# Altium schematic sheet Buttons_Section.SchDoc
size A4; DocumentNumber: 5; SheetNumber: 5; SheetTotal: 6
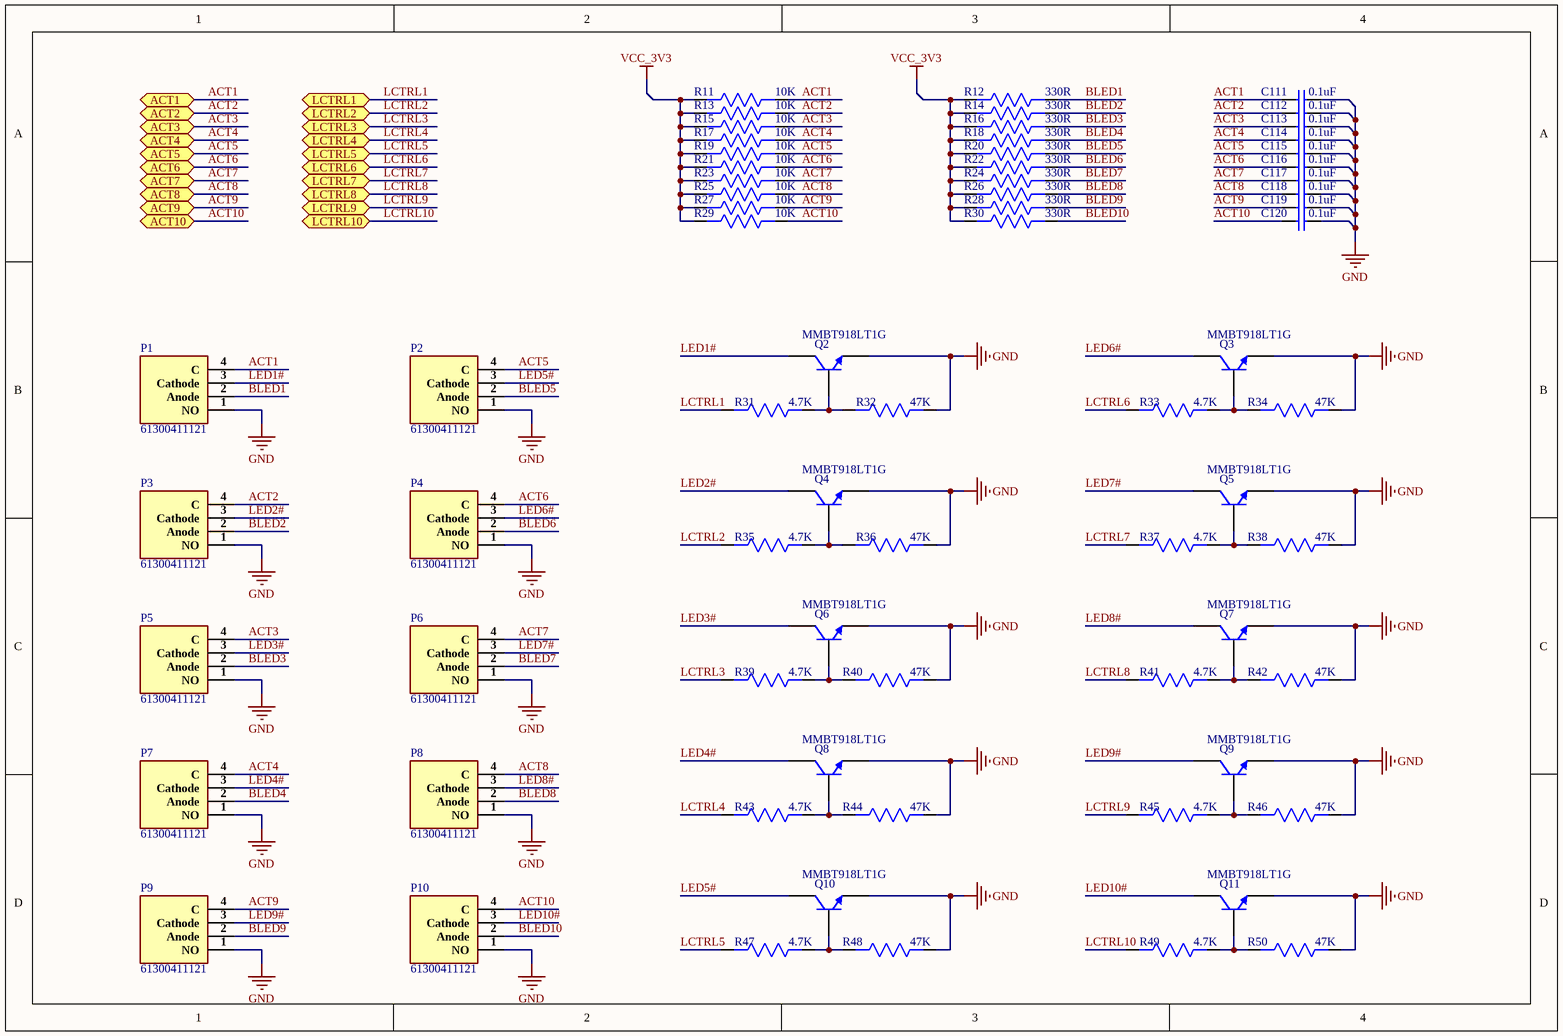
[diagram p0: Buttons_Section.SchDoc]

## Parts
C111  0.1uF  [Cap0402]
C112  0.1uF  [Cap0402]
C113  0.1uF  [Cap0402]
C114  0.1uF  [Cap0402]
C115  0.1uF  [Cap0402]
C116  0.1uF  [Cap0402]
C117  0.1uF  [Cap0402]
C118  0.1uF  [Cap0402]
C119  0.1uF  [Cap0402]
C120  0.1uF  [Cap0402]
P1  61300411121  [HDR1X4]
P2  61300411121  [HDR1X4]
P3  61300411121  [HDR1X4]
P4  61300411121  [HDR1X4]
P5  61300411121  [HDR1X4]
P6  61300411121  [HDR1X4]
P7  61300411121  [HDR1X4]
P8  61300411121  [HDR1X4]
P9  61300411121  [HDR1X4]
P10  61300411121  [HDR1X4]
Q2  MMBT918LT1G  [SOT23-3]
Q3  MMBT918LT1G  [SOT23-3]
Q4  MMBT918LT1G  [SOT23-3]
Q5  MMBT918LT1G  [SOT23-3]
Q6  MMBT918LT1G  [SOT23-3]
Q7  MMBT918LT1G  [SOT23-3]
Q8  MMBT918LT1G  [SOT23-3]
Q9  MMBT918LT1G  [SOT23-3]
Q10  MMBT918LT1G  [SOT23-3]
Q11  MMBT918LT1G  [SOT23-3]
R11  10K  [Res0402]
R12  330R  [Res0603]
R13  10K  [Res0402]
R14  330R  [Res0603]
R15  10K  [Res0402]
R16  330R  [Res0603]
R17  10K  [Res0402]
R18  330R  [Res0603]
R19  10K  [Res0402]
R20  330R  [Res0603]
R21  10K  [Res0402]
R22  330R  [Res0603]
R23  10K  [Res0402]
R24  330R  [Res0603]
R25  10K  [Res0402]
R26  330R  [Res0603]
R27  10K  [Res0402]
R28  330R  [Res0603]
R29  10K  [Res0402]
R30  330R  [Res0603]
R31  4.7K  [Res0402]
R32  47K  [Res0402]
R33  4.7K  [Res0402]
R34  47K  [Res0402]
R35  4.7K  [Res0402]
R36  47K  [Res0402]
R37  4.7K  [Res0402]
R38  47K  [Res0402]
R39  4.7K  [Res0402]
R40  47K  [Res0402]
R41  4.7K  [Res0402]
R42  47K  [Res0402]
R43  4.7K  [Res0402]
R44  47K  [Res0402]
R45  4.7K  [Res0402]
R46  47K  [Res0402]
R47  4.7K  [Res0402]
R48  47K  [Res0402]
R49  4.7K  [Res0402]
R50  47K  [Res0402]

## Ports
ACT1 (bidir), ACT2 (bidir), ACT3 (bidir), ACT4 (bidir), ACT5 (bidir), ACT6 (bidir), ACT7 (bidir), ACT8 (bidir), ACT9 (bidir), ACT10 (bidir), LCTRL1 (bidir), LCTRL2 (bidir), LCTRL3 (bidir), LCTRL4 (bidir), LCTRL5 (bidir), LCTRL6 (bidir), LCTRL7 (bidir), LCTRL8 (bidir), LCTRL9 (bidir), LCTRL10 (bidir)

## Nets
GND: C111.2 C112.2 C113.2 C114.2 C115.2 C116.2 C117.2 C118.2 C119.2 C120.2 P1.1(NO) P2.1(NO) P3.1(NO) P4.1(NO) P5.1(NO) P6.1(NO) P7.1(NO) P8.1(NO) P9.1(NO) P10.1(NO) Q2.2(E) Q3.2(E) Q4.2(E) Q5.2(E) Q6.2(E) Q7.2(E) Q8.2(E) Q9.2(E) Q10.2(E) Q11.2(E) R32.1 R34.1 R36.1 R38.1 R40.1 R42.1 R44.1 R46.1 R48.1 R50.1
VCC_3V3: R11.2 R12.2 R13.2 R14.2 R15.2 R16.2 R17.2 R18.2 R19.2 R20.2 R21.2 R22.2 R23.2 R24.2 R25.2 R26.2 R27.2 R28.2 R29.2 R30.2
ACT1: C111.1 P1.4(C) R11.1 ; port ACT1
ACT2: C112.1 P3.4(C) R13.1 ; port ACT2
ACT3: C113.1 P5.4(C) R15.1 ; port ACT3
ACT4: C114.1 P7.4(C) R17.1 ; port ACT4
ACT5: C115.1 P2.4(C) R19.1 ; port ACT5
ACT6: C116.1 P4.4(C) R21.1 ; port ACT6
ACT7: C117.1 P6.4(C) R23.1 ; port ACT7
ACT8: C118.1 P8.4(C) R25.1 ; port ACT8
ACT9: C119.1 P9.4(C) R27.1 ; port ACT9
ACT10: C120.1 P10.4(C) R29.1 ; port ACT10
BLED1: P1.2(Anode) R12.1
BLED2: P3.2(Anode) R14.1
BLED3: P5.2(Anode) R16.1
BLED4: P7.2(Anode) R18.1
BLED5: P2.2(Anode) R20.1
BLED6: P4.2(Anode) R22.1
BLED7: P6.2(Anode) R24.1
BLED8: P8.2(Anode) R26.1
BLED9: P9.2(Anode) R28.1
BLED10: P10.2(Anode) R30.1
LCTRL1: R31.1 ; port LCTRL1
LCTRL2: R35.1 ; port LCTRL2
LCTRL3: R39.1 ; port LCTRL3
LCTRL4: R43.1 ; port LCTRL4
LCTRL5: R47.1 ; port LCTRL5
LCTRL6: R33.1 ; port LCTRL6
LCTRL7: R37.1 ; port LCTRL7
LCTRL8: R41.1 ; port LCTRL8
LCTRL9: R45.1 ; port LCTRL9
LCTRL10: R49.1 ; port LCTRL10
LED1#: P1.3(Cathode) Q2.3(C)
LED2#: P3.3(Cathode) Q4.3(C)
LED3#: P5.3(Cathode) Q6.3(C)
LED4#: P7.3(Cathode) Q8.3(C)
LED5#: P2.3(Cathode) Q10.3(C)
LED6#: P4.3(Cathode) Q3.3(C)
LED7#: P6.3(Cathode) Q5.3(C)
LED8#: P8.3(Cathode) Q7.3(C)
LED9#: P9.3(Cathode) Q9.3(C)
LED10#: P10.3(Cathode) Q11.3(C)
NetQ2_1: Q2.1(B) R31.2 R32.2
NetQ3_1: Q3.1(B) R33.2 R34.2
NetQ4_1: Q4.1(B) R35.2 R36.2
NetQ5_1: Q5.1(B) R37.2 R38.2
NetQ6_1: Q6.1(B) R39.2 R40.2
NetQ7_1: Q7.1(B) R41.2 R42.2
NetQ8_1: Q8.1(B) R43.2 R44.2
NetQ9_1: Q9.1(B) R45.2 R46.2
NetQ10_1: Q10.1(B) R47.2 R48.2
NetQ11_1: Q11.1(B) R49.2 R50.2

## Library data of the parts
C111-C120 = CC0402KRX7R7BB104: CAP CER 0.1UF 16V X7R 0402; Manufacturer: Yageo; Tolerance: 10%; Capacitance: 100nF; Supplier 1: Digi-Key; Manufacturer Part Number: CC0402KRX7R7BB104; Stock 1: 16982736; Pricing 1: 1=0.1, 10=0.034, 100=0.015, 500=0.0107, 1000=0.00841, 2500=0.00764, 5000=0.00703 (USD); Mount: Surface Mount; Case/Package: 0402; Number of Pins: 2; Case Code (Metric): 1005; Case Code (Imperial): 0402; Min Operating Temperature: -55°C; Max Operating Temperature: 125°C; Dielectric: X7R; Voltage Rating: 16V; Voltage Rating (DC): 16V; Packaging: Tape and Reel; Package Quantity: 1; Termination: SMD/SMT; Composition: Ceramic; Voltage: 16V; Length: 1mm; Height: 0.5mm; Width: 0.02inch; Thickness: 0.022inch; Depth: 0.5mm; Radiation Hardening: No; REACH SVHC: No SVHC; Lead Free: Lead Free; Halogen Free: Halogen Free; ComponentLink1URL: http://www.yageo.com/documents/recent/UPY-GPHC_X7R_6.3V-to-50V_8.pdf?src-supplier=Avnet+Europe; ComponentLink1Description: http://www.yageo.com/documents/recent/UPY-GPHC_X7R_6.3V-to-50V_8.pdf?src-supplier=Avnet+Europe; ComponentLink2URL: http://www.yageo.com/documents/recent/UPY-GPHC_X7R_6.3V-to-50V_18.pdf?src-supplier=Digi-Key; ComponentLink2Description: http://www.yageo.com/documents/recent/UPY-GPHC_X7R_6.3V-to-50V_18.pdf?src-supplier=Digi-Key; ComponentLink3URL: http://www.yageo.com/documents/recent/UPY-GPHC_X7R_6.3V-to-50V_8.pdf?src-supplier=Avnet; ComponentLink3Description: http://www.yageo.com/documents/recent/UPY-GPHC_X7R_6.3V-to-50V_8.pdf?src-supplier=Avnet; ComponentLink4URL: http://www.yageo.com/documents/recent/UPY-GPHC_X7R_6.3V-to-50V_18.pdf?src-supplier=Mouser; ComponentLink4Description: http://www.yageo.com/documents/recent/UPY-GPHC_X7R_6.3V-to-50V_18.pdf?src-supplier=Mouser; ComponentLink5URL: http://www.farnell.com/datasheets/2167236.pdf?src-supplier=Element14; ComponentLink5Description: http://www.farnell.com/datasheets/2167236.pdf?src-supplier=Element14; ComponentLink6URL: http://www.farnell.com/datasheets/1489800.pdf?src-supplier=Element14; ComponentLink6Description: http://www.farnell.com/datasheets/1489800.pdf?src-supplier=Element14; Supplier Part Number 1: 311-1338-1-ND
P1-P10 = 12MM Button: CONN HEADER VERT 4POS 2.54MM; Manufacturer: Wurth Electronics; Number of Positions: 4; Gender: Male; Connector Type: Male Pin; Pitch: 0.1inch; Supplier 1: Digi-Key; Manufacturer Part Number: 61300411121; Stock 1: 20544; Pricing 1: 1=0.18, 10=0.153, 25=0.1272, 50=0.106, 100=0.096, 1000=0.088 (USD); Mount: Through Hole; Contact Plating: Gold; Contact Material: Copper; Color: Black; Number of Rows: 1; Packaging: Bulk; Termination: Solder; Number of Contacts: 4; Contact Mating Length: 0.236inch; REACH SVHC: Unknown; Lead Free: Lead Free; ComponentLink1URL: http://www.farnell.com/cad/1737268.pdf?src-supplier=Element14; ComponentLink1Description: http://www.farnell.com/cad/1737268.pdf?src-supplier=Element14; ComponentLink2URL: https://katalog.we-online.de/em/datasheet/6130xx11121.pdf?src-supplier=Digi-Key; ComponentLink2Description: https://katalog.we-online.de/em/datasheet/6130xx11121.pdf?src-supplier=Digi-Key; Supplier Part Number 1: 732-5317-ND
Q2-Q11 = MMBT918LT1G: NPN 50mA 15V 225mW SOT-23(SOT-23-3) Transistors (NPN/PNP) RoHS; Manufacturer: ON Semiconductor; hFE Min: 20; Frequency: 600MHz; Number of Elements: 1; Collector Base Voltage (VCBO): 30V; Emitter Base Voltage (VEBO): 3V; Collector Emitter Saturation Voltage: 400mV; Gain: 11dB; Power Dissipation: 300mW; Element Configuration: Single; Supplier 1: Digi-Key; Manufacturer Part Number: MMBT918LT1G; Stock 1: 8100; Pricing 1: 1=0.28, 10=0.229, 25=0.1916, 100=0.1214, 250=0.09372, 500=0.07988, 1000=0.05432 (USD); Case/Package: SOT-23-3; Number of Pins: 3; Contact Plating: Tin,Matte; Min Operating Temperature: -55°C; Max Operating Temperature: 150°C; Max Power Dissipation: 225mW; Package Quantity: 3000; Packaging: Tape and Reel; Polarity: NPN; Collector Emitter Voltage (VCEO): 15V; Max Collector Current: 50mA; Collector Emitter Breakdown Voltage: 15V; Transition Frequency: 600MHz; Max Breakdown Voltage: 15V; Max Frequency: 600MHz; Gain Bandwidth Product: 600MHz; Voltage Rating (DC): 15V; Current Rating: 50mA; Length: 3.04mm; Height: 1.01mm; Width: 1.4mm; Radiation Hardening: No; REACH SVHC: No SVHC; Lead Free: Lead Free; ComponentLink1URL: http://www.onsemi.com/pub/Collateral/MMBT918LT1-D.PDF?src-supplier=Avnet; ComponentLink1Description: http://www.onsemi.com/pub/Collateral/MMBT918LT1-D.PDF?src-supplier=Avnet; ComponentLink2URL: http://www.mouser.com/ds/2/308/MMBT918LT1-D-111406.pdf?src-supplier=Mouser; ComponentLink2Description: http://www.mouser.com/ds/2/308/MMBT918LT1-D-111406.pdf?src-supplier=Mouser; ComponentLink3URL: https://www.verical.com/server-webapp/html/getDatasheet?partID=70260&src-supplier=Verical; ComponentLink3Description: https://www.verical.com/server-webapp/html/getDatasheet?partID=70260&src-supplier=Verical; ComponentLink4URL: http://www.onsemi.com/pub/Collateral/MMBT918LT1-D.PDF?src-supplier=Future+Electronics; ComponentLink4Description: http://www.onsemi.com/pub/Collateral/MMBT918LT1-D.PDF?src-supplier=Future+Electronics; ComponentLink5URL: http://www.onsemi.com/pub/Collateral/MMBT918LT1-D.PDF?src-supplier=Digi-Key; ComponentLink5Description: http://www.onsemi.com/pub/Collateral/MMBT918LT1-D.PDF?src-supplier=Digi-Key; ComponentLink6URL: http://www.onsemi.com/pub/Collateral/MMBT918LT1-D.PDF?src-supplier=Avnet+Europe; ComponentLink6Description: http://www.onsemi.com/pub/Collateral/MMBT918LT1-D.PDF?src-supplier=Avnet+Europe; ComponentLink7URL: http://uk.rs-online.com/webdocs/1276/0900766b81276ae8.pdf?src-supplier=RSComponents; ComponentLink7Description: http://uk.rs-online.com/webdocs/1276/0900766b81276ae8.pdf?src-supplier=RSComponents; Supplier Part Number 1: MMBT918LT1GOSCT-ND
R11 R13 R15 R17 R19 R21 R23 R25 R27 R29 = RK73B1ETTP103J: RES 10K OHM 5% 1/10W 0402; Manufacturer: KOA Speer; Resistance: 10kR; Power Rating: 63mW; Voltage Rating: 50V; Temperature Coefficient: 200ppm/°C; Supplier 1: Digi-Key; Manufacturer Part Number: RK73B1ETTP103J; Stock 1: 2917894; Pricing 1: 1=0.1, 10=0.016, 100=0.0065, 1000=0.00292, 2500=0.00253, 5000=0.00209 (USD); Mount: Surface Mount; Case/Package: 0402; Case Code (Imperial): 0402; Case Code (Metric): 1005; Min Operating Temperature: -55°C; Max Operating Temperature: 155°C; Packaging: Tape and Reel; Tolerance: 5%; Package Quantity: 10000; Composition: Thick Film; Termination: SMD/SMT; Military Standard: Not; Voltage Rating (DC): 50V; Length: 1mm; Height: 0.35mm; Width: 0.5mm; Depth: 0.5mm; Lead Free: Lead Free; ComponentLink1URL: https://www.verical.com/server-webapp/html/getDatasheet?partID=89073&src-supplier=Verical; ComponentLink1Description: https://www.verical.com/server-webapp/html/getDatasheet?partID=89073&src-supplier=Verical; Supplier Part Number 1: 2019-RK73B1ETTP103JCT-ND
R12 R14 R16 R18 R20 R22 R24 R26 R28 R30 = RC0603FR-07330RL: RES SMD 330 OHM 1% 1/10W 0603; Manufacturer: Yageo; Temperature Coefficient: 100ppm/°C; Voltage Rating (DC): 50V; Power Rating: 100mW; Supplier 1: Digi-Key; Manufacturer Part Number: RC0603FR-07330RL; Stock 1: 9084897; Pricing 1: 1=0.1, 10=0.024, 100=0.0097, 1000=0.00437, 2500=0.00379 (USD); Case/Package: 0603; Number of Pins: 2; Case Code (Metric): 1608; Case Code (Imperial): 0603; Min Operating Temperature: -55°C; Max Operating Temperature: 155°C; Resistance: 330R; Tolerance: 1%; Composition: Thick Film; Packaging: Tape and Reel; Voltage Rating: 50V; Package Quantity: 1; Number of Terminations: 2; Termination: SMD/SMT; Max Power Dissipation: 100mW; Features: Moisture Resistant; Length: 1.6mm; Height: 0.45mm; Width: 0.8mm; Depth: 0.8mm; REACH SVHC: No SVHC; Lead Free: Lead Free; ComponentLink1URL: http://www.yageo.com/documents/recent/PYu-RC_Group_51_RoHS_L_10.pdf?src-supplier=Digi-Key; ComponentLink1Description: http://www.yageo.com/documents/recent/PYu-RC_Group_51_RoHS_L_10.pdf?src-supplier=Digi-Key; ComponentLink2URL: http://www.farnell.com/datasheets/2167052.pdf?src-supplier=Mouser; ComponentLink2Description: http://www.farnell.com/datasheets/2167052.pdf?src-supplier=Mouser; ComponentLink3URL: http://www.farnell.com/datasheets/1868787.pdf?src-supplier=Element14; ComponentLink3Description: http://www.farnell.com/datasheets/1868787.pdf?src-supplier=Element14; ComponentLink4URL: http://www.farnell.com/datasheets/443971.pdf?src-supplier=Element14; ComponentLink4Description: http://www.farnell.com/datasheets/443971.pdf?src-supplier=Element14; ComponentLink5URL: http://www.farnell.com/datasheets/1686128.pdf?src-supplier=Element14; ComponentLink5Description: http://www.farnell.com/datasheets/1686128.pdf?src-supplier=Element14; ComponentLink6URL: http://documents.rs-components.com/techlib://itc_doclist_GB.htm?stockno=5046499&src-supplier=RSComponents; ComponentLink6Description: http://documents.rs-components.com/techlib://itc_doclist_GB.htm?stockno=5046499&src-supplier=RSComponents; Supplier Part Number 1: 311-330HRCT-ND
R31 R33 R35 R37 R39 R41 R43 R45 R47 R49 = RC0402FR-074K7L: RES SMD 4.7K OHM 1% 1/16W 0402; Manufacturer: Yageo; Voltage Rating (DC): 50V; Power Rating: 62.5mW; Resistance: 4.7kR; Temperature Coefficient: 100ppm/°C; Supplier 1: Digi-Key; Manufacturer Part Number 1: RC0402FR-074K7L; Stock 1: 26143098; Pricing 1: 1=0.1, 10=0.016, 100=0.0067, 1000=0.003, 2500=0.0026, 5000=0.0022 (USD); Case/Package: 0402; Number of Pins: 2; Case Code (Imperial): 0402; Case Code (Metric): 1005; Min Operating Temperature: -55°C; Max Operating Temperature: 155°C; Tolerance: 1%; Voltage Rating: 50V; Packaging: Tape and Reel; Composition: Thick Film; Termination: SMD/SMT; Military Standard: Not; Length: 1mm; Height: 0.32mm; Width: 0.5mm; Depth: 0.5mm; REACH SVHC: No SVHC; Lead Free: Lead Free; ComponentLink1URL: http://www.farnell.com/datasheets/1018594.pdf?src-supplier=Element14; ComponentLink1Description: http://www.farnell.com/datasheets/1018594.pdf?src-supplier=Element14; ComponentLink2URL: https://www.verical.com/server-webapp/html/getDatasheet?partID=328119&src-supplier=Verical; ComponentLink2Description: https://www.verical.com/server-webapp/html/getDatasheet?partID=328119&src-supplier=Verical; ComponentLink3URL: http://www.farnell.com/datasheets/1686128.pdf?src-supplier=Element14; ComponentLink3Description: http://www.farnell.com/datasheets/1686128.pdf?src-supplier=Element14; Supplier Part Number 1: 311-4.7KLRCT-ND
R32 R34 R36 R38 R40 R42 R44 R46 R48 R50 = RC0402FR-0747KL: RES SMD 47K OHM 1% 1/16W 0402; Manufacturer: Yageo; Power Rating: 62.5mW; Temperature Coefficient: 100ppm/°C; Voltage Rating: 50V; Resistance: 47kR; Max Power Dissipation: 63mW; Supplier 1: Digi-Key; Manufacturer Part Number: RC0402FR-0747KL; Stock 1: 0; Pricing 1: 1=0.1, 10=0.016, 100=0.0064, 1000=0.00289, 2500=0.00251, 5000=0.00207 (USD); Case/Package: 0402; Case Code (Imperial): 0402; Case Code (Metric): 1005; Min Operating Temperature: -55°C; Max Operating Temperature: 155°C; Tolerance: 1%; Packaging: Tape and Reel; Package Quantity: 1; Termination: SMD/SMT; Composition: Thick Film; Number of Terminations: 2; Military Standard: Not; Features: Moisture Resistant; Length: 1mm; Height: 0.016inch; Depth: 0.5mm; Width: 0.5mm; REACH SVHC: Unknown; Lead Free: Lead Free; ComponentLink1URL: http://www.yageo.com/documents/recent/PYu-RC0402_51_RoHS_L_6_r.pdf?src-supplier=Future+Electronics; ComponentLink1Description: http://www.yageo.com/documents/recent/PYu-RC0402_51_RoHS_L_6_r.pdf?src-supplier=Future+Electronics; ComponentLink2URL: http://www.farnell.com/datasheets/1018594.pdf?src-supplier=Element14; ComponentLink2Description: http://www.farnell.com/datasheets/1018594.pdf?src-supplier=Element14; ComponentLink3URL: https://www.verical.com/server-webapp/html/getDatasheet?partID=323748&src-supplier=Verical; ComponentLink3Description: https://www.verical.com/server-webapp/html/getDatasheet?partID=323748&src-supplier=Verical; ComponentLink4URL: http://www.yageo.com/documents/recent/PYu-RC_Group_51_RoHS_L_10.pdf?src-supplier=Digi-Key; ComponentLink4Description: http://www.yageo.com/documents/recent/PYu-RC_Group_51_RoHS_L_10.pdf?src-supplier=Digi-Key; Supplier Part Number 1: 311-47.0KLRDKR-ND